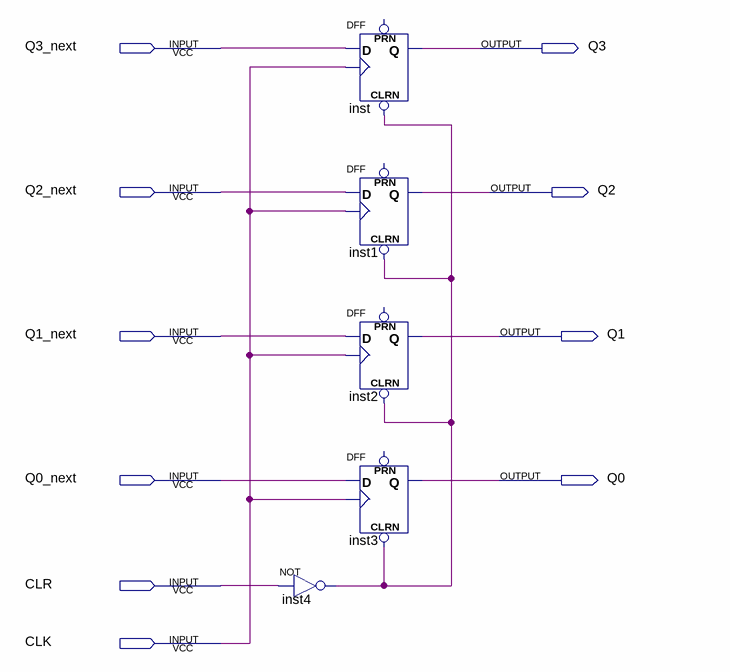
[diagram p0: schematic sheet]
// Quartus schematic current_state.bdf as structural Verilog: 5 symbols, 10 pins
module current_state (
  input  Q3_next,
  input  Q2_next,
  input  Q1_next,
  input  Q0_next,
  input  CLR,
  input  CLK,
  output Q3,
  output Q2,
  output Q1,
  output Q0
);

  wire inst4_out;

  not inst4 (inst4_out, CLR);
  DFF inst (.CLRN(inst4_out), .CLK(CLK), .D(Q3_next), .Q(Q3));  // open: PRN
  DFF inst1 (.CLRN(inst4_out), .CLK(CLK), .D(Q2_next), .Q(Q2));  // open: PRN
  DFF inst2 (.CLRN(inst4_out), .CLK(CLK), .D(Q1_next), .Q(Q1));  // open: PRN
  DFF inst3 (.CLRN(inst4_out), .CLK(CLK), .D(Q0_next), .Q(Q0));  // open: PRN
endmodule
